# Altium project Pukk-Display-Module-v1.0.PrjPcb (part 4 of 4)
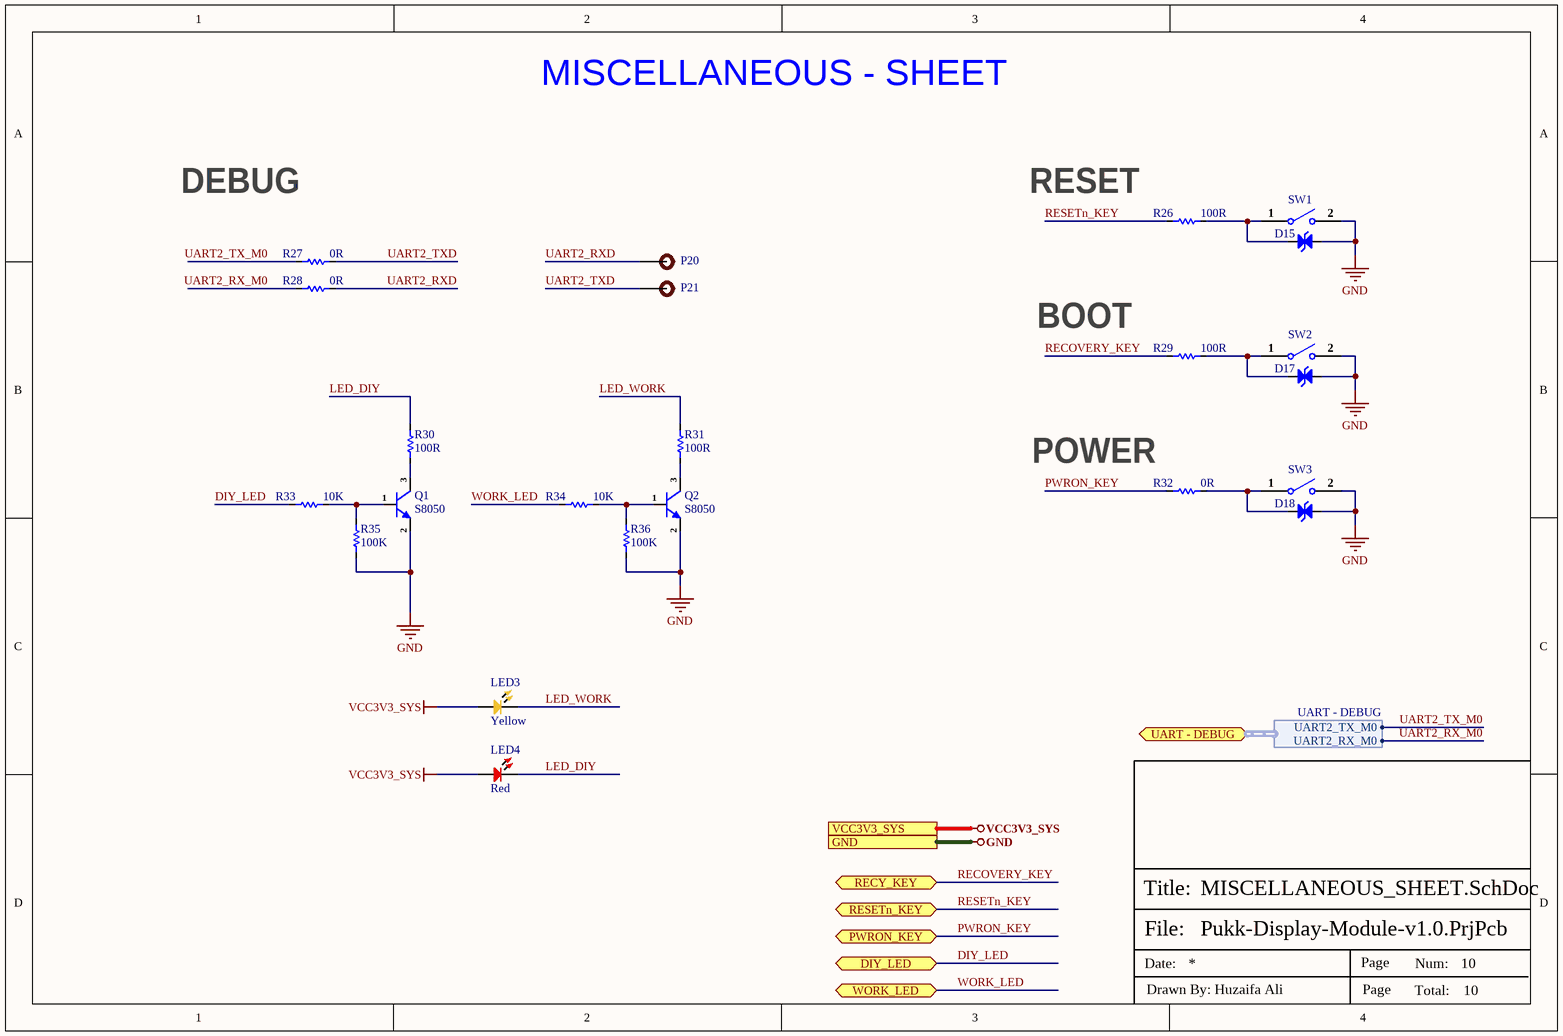
[diagram p10: MISCELLANEOUS_SHEET.SchDoc]

## Nets that join several sheets
GND: POWER_SHEET (11 pins), radxa_CM3J_SHEET-1 (25 pins), radxa_CM3J_SHEET-2 (30 pins), CAN_SHEET (8 pins), TYPE-C_INTERFACE_SHEET (15 pins), MIPI_DISPLAY-SHEET (18 pins), HDMI2.0_SHEET (13 pins), GPS_INTERFACE_SHEET (12 pins), JOYSTICK_BUTTON_SHEET (12 pins), MISCELLANEOUS_SHEET (10 pins)
VCC3V3: radxa_CM3J_SHEET-1 (6 pins), CAN_SHEET (C13.2 C14.2 U2.5), JOYSTICK_BUTTON_SHEET (8 pins)
VCC3V3_SYS: POWER_SHEET (C34.2 C35.2 U8.2), MIPI_DISPLAY-SHEET (FB1.1 R15.2 R19.2), GPS_INTERFACE_SHEET (10 pins), MISCELLANEOUS_SHEET (LED3.1 LED4.1)
VCC5V0_SYS: POWER_SHEET (5 pins), radxa_CM3J_SHEET-1 (8 pins), CAN_SHEET (C11.2 C12.2 U2.3), TYPE-C_INTERFACE_SHEET (C15.2 C16.2 R12.1), MIPI_DISPLAY-SHEET (C21.2 L2.1 U5.6), HDMI2.0_SHEET (C19.2 U4.3)
BUTTON_CENTER: radxa_CM3J_SHEET-1 (U13A.46), JOYSTICK_BUTTON_SHEET (U16.12)
BUTTON_DOWN: radxa_CM3J_SHEET-1 (U13A.58), JOYSTICK_BUTTON_SHEET (U16.4)
BUTTON_LEFT: radxa_CM3J_SHEET-1 (U13A.26), JOYSTICK_BUTTON_SHEET (U16.2)
BUTTON_RIGHT: radxa_CM3J_SHEET-1 (U13A.24), JOYSTICK_BUTTON_SHEET (U16.6)
BUTTON_SELECT: radxa_CM3J_SHEET-1 (U13A.44), JOYSTICK_BUTTON_SHEET (U16.10)
BUTTON_UP: radxa_CM3J_SHEET-1 (U13A.56), JOYSTICK_BUTTON_SHEET (U16.8)
CAN0_RX_M1: radxa_CM3J_SHEET-1 (U13A.57), CAN_SHEET (R10.1)
CAN0_TX_M1: radxa_CM3J_SHEET-1 (U13A.62), CAN_SHEET (R8.1)
CAN_STB: radxa_CM3J_SHEET-1 (U13A.61), CAN_SHEET (R6.1)
DIY_LED: radxa_CM3J_SHEET-1 (U13A.95), MISCELLANEOUS_SHEET (R33.1)
ENC_CHA: radxa_CM3J_SHEET-1 (R38.1 U13A.48), JOYSTICK_BUTTON_SHEET (D16.2 P22.1)
ENC_CHB: radxa_CM3J_SHEET-1 (R39.1 U13A.50), JOYSTICK_BUTTON_SHEET (D24.2 P23.1)
HDMI_TX0_N: radxa_CM3J_SHEET-2 (U13B.84), HDMI2.0_SHEET (D8.1 D8.10 J2.11)
HDMI_TX0_P: radxa_CM3J_SHEET-2 (U13B.82), HDMI2.0_SHEET (D8.2 D8.9 J2.9)
HDMI_TX1_N: radxa_CM3J_SHEET-2 (U13B.78), HDMI2.0_SHEET (D9.5 D9.6 J2.8)
HDMI_TX1_P: radxa_CM3J_SHEET-2 (U13B.76), HDMI2.0_SHEET (D9.4 D9.7 J2.6)
HDMI_TX2_N: radxa_CM3J_SHEET-2 (U13B.72), HDMI2.0_SHEET (D8.4 D8.7 J2.5)
HDMI_TX2_P: radxa_CM3J_SHEET-2 (U13B.70), HDMI2.0_SHEET (D8.5 D8.6 J2.3)
HDMI_TX_CEC: radxa_CM3J_SHEET-2 (U13B.51), HDMI2.0_SHEET (D9.2 D9.9 J2.15)
HDMI_TX_HPD: radxa_CM3J_SHEET-2 (U13B.53), HDMI2.0_SHEET (D9.1 D9.10 J2.1)
HDMI_TX_SCL: radxa_CM3J_SHEET-2 (U13B.100), HDMI2.0_SHEET (D10.5 D10.6 J2.17)
HDMI_TX_SDA: radxa_CM3J_SHEET-2 (U13B.99), HDMI2.0_SHEET (D10.4 D10.7 J2.18)
HDMI_TXCLK_N: radxa_CM3J_SHEET-2 (U13B.90), HDMI2.0_SHEET (D10.1 D10.10 J2.14)
HDMI_TXCLK_P: radxa_CM3J_SHEET-2 (U13B.88), HDMI2.0_SHEET (D10.2 D10.9 J2.12)
LCD0_PWM: radxa_CM3J_SHEET-1 (U13A.31), MIPI_DISPLAY-SHEET (R16.1)
LCD0_RST: radxa_CM3J_SHEET-1 (U13A.29), MIPI_DISPLAY-SHEET (R20.1)
MIPI_DSI_TX1_CLK_N: radxa_CM3J_SHEET-2 (U13B.87), MIPI_DISPLAY-SHEET (J3.18)
MIPI_DSI_TX1_CLK_P: radxa_CM3J_SHEET-2 (U13B.89), MIPI_DISPLAY-SHEET (J3.17)
MIPI_DSI_TX1_D0_N: radxa_CM3J_SHEET-2 (U13B.75), MIPI_DISPLAY-SHEET (J3.24)
MIPI_DSI_TX1_D0_P: radxa_CM3J_SHEET-2 (U13B.77), MIPI_DISPLAY-SHEET (J3.23)
MIPI_DSI_TX1_D1_N: radxa_CM3J_SHEET-2 (U13B.81), MIPI_DISPLAY-SHEET (J3.21)
MIPI_DSI_TX1_D1_P: radxa_CM3J_SHEET-2 (U13B.83), MIPI_DISPLAY-SHEET (J3.20)
MIPI_DSI_TX1_D2_N: radxa_CM3J_SHEET-2 (U13B.93), MIPI_DISPLAY-SHEET (J3.15)
MIPI_DSI_TX1_D2_P: radxa_CM3J_SHEET-2 (U13B.95), MIPI_DISPLAY-SHEET (J3.14)
MIPI_DSI_TX1_D3_N: radxa_CM3J_SHEET-2 (U13B.94), MIPI_DISPLAY-SHEET (J3.12)
MIPI_DSI_TX1_D3_P: radxa_CM3J_SHEET-2 (U13B.96), MIPI_DISPLAY-SHEET (J3.11)
PWRON_KEY: radxa_CM3J_SHEET-1 (U13A.99), MISCELLANEOUS_SHEET (R32.1)
RECOVERY_KEY: radxa_CM3J_SHEET-1 (U13A.93), MISCELLANEOUS_SHEET (R29.2)
RESETn_KEY: radxa_CM3J_SHEET-1 (U13A.92), MISCELLANEOUS_SHEET (R26.2)
UART2_RX_M0: radxa_CM3J_SHEET-1 (U13A.55), MISCELLANEOUS_SHEET (R28.1)
UART2_TX_M0: radxa_CM3J_SHEET-1 (U13A.51), MISCELLANEOUS_SHEET (R27.1)
UART6_RX_M1: radxa_CM3J_SHEET-1 (U13A.67), GPS_INTERFACE_SHEET (R25.1)
UART6_TX_M1: radxa_CM3J_SHEET-1 (U13A.63), GPS_INTERFACE_SHEET (R24.1)
USB_OTG0_D_N: radxa_CM3J_SHEET-2 (U13B.3), TYPE-C_INTERFACE_SHEET (L1.1)
USB_OTG0_D_P: radxa_CM3J_SHEET-2 (U13B.5), TYPE-C_INTERFACE_SHEET (L1.2)
WORK_LED: radxa_CM3J_SHEET-1 (U13A.21), MISCELLANEOUS_SHEET (R34.1)